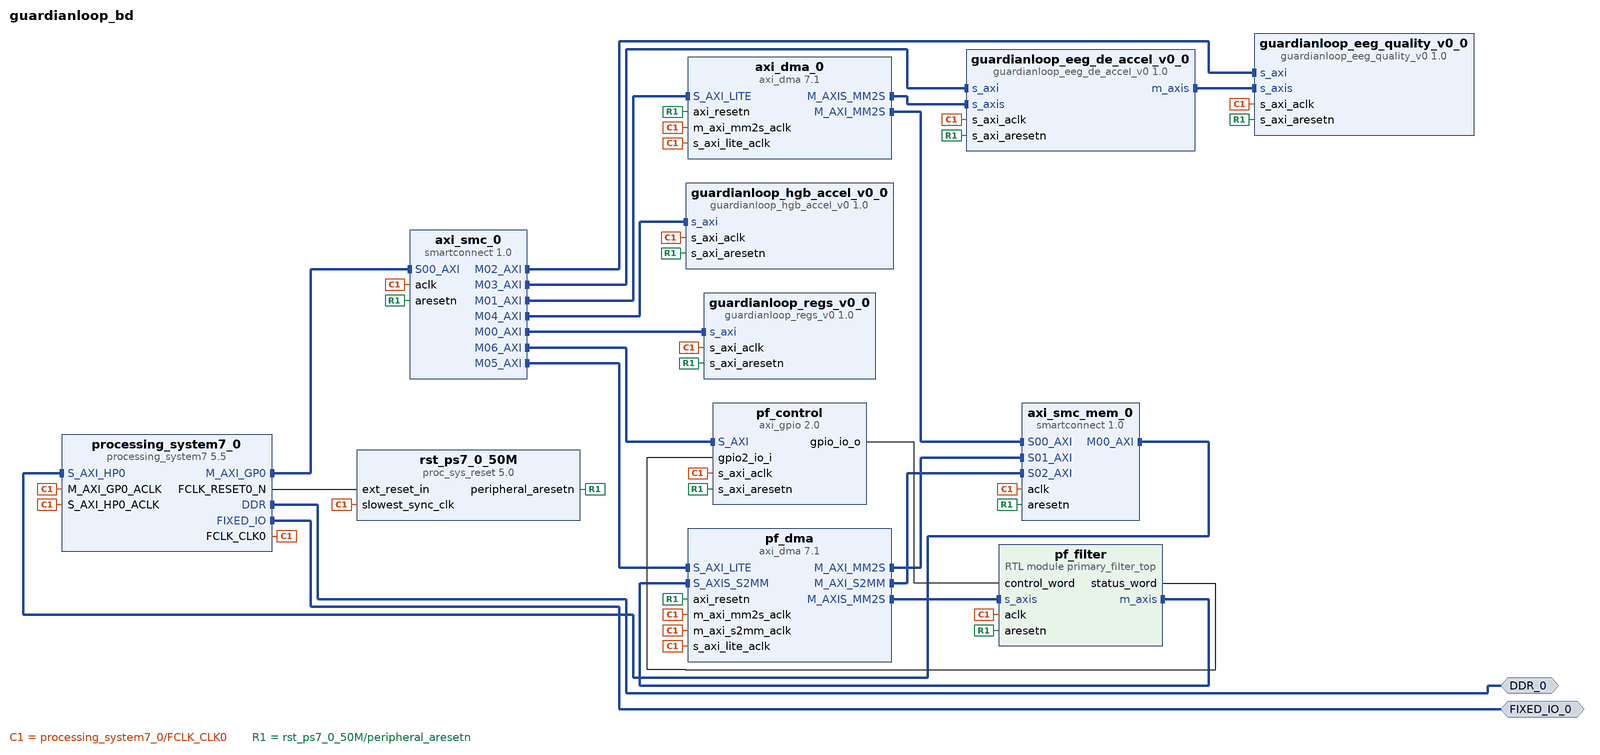
[diagram p0: block diagram of the top level]
# Vivado block design guardianloop_bd, xc7z015clg485-2, Vivado 2025.2
create_bd_design guardianloop_bd

create_bd_intf_port -mode Master -vlnv xilinx.com:interface:ddrx_rtl:1.0 DDR_0
create_bd_intf_port -mode Master -vlnv xilinx.com:display_processing_system7:fixedio_rtl:1.0 FIXED_IO_0

create_bd_cell -type ip -vlnv xilinx.com:ip:processing_system7:5.5 processing_system7_0
set_property -dict [list \
  CONFIG.PCW_FPGA0_PERIPHERAL_FREQMHZ 50 \
  CONFIG.PCW_QSPI_GRP_SINGLE_SS_ENABLE 1 \
  CONFIG.PCW_QSPI_GRP_SINGLE_SS_IO {MIO 1 .. 6} \
  CONFIG.PCW_QSPI_PERIPHERAL_ENABLE 1 \
  CONFIG.PCW_QSPI_QSPI_IO {MIO 1 .. 6} \
  CONFIG.PCW_SINGLE_QSPI_DATA_MODE x4 \
  CONFIG.PCW_UART0_PERIPHERAL_ENABLE 1 \
  CONFIG.PCW_UART0_UART0_IO {MIO 14 .. 15} \
  CONFIG.PCW_UART_PERIPHERAL_FREQMHZ 100 \
  CONFIG.PCW_UIPARAM_DDR_FREQ_MHZ 533.333333 \
  CONFIG.PCW_UIPARAM_DDR_MEMORY_TYPE {DDR 3 (Low Voltage)} \
  CONFIG.PCW_UIPARAM_DDR_PARTNO Custom \
  CONFIG.PCW_USE_S_AXI_HP0 1 \
] [get_bd_cells processing_system7_0]
# 142 more settings of processing_system7_0 are not shown: defaults, MIO pin electricals, DDR timing, and values the tool derives
create_bd_cell -type ip -vlnv xilinx.com:ip:proc_sys_reset:5.0 rst_ps7_0_50M
create_bd_cell -type ip -vlnv xilinx.com:ip:smartconnect:1.0 axi_smc_0
set_property -dict {CONFIG.NUM_MI 7 CONFIG.NUM_SI 1} [get_bd_cells axi_smc_0]
create_bd_cell -type ip -vlnv guardianloop.org:user:guardianloop_regs_v0:1.0 guardianloop_regs_v0_0
create_bd_cell -type ip -vlnv xilinx.com:ip:axi_dma:7.1 axi_dma_0
set_property -dict [list \
  CONFIG.c_include_s2mm 0 \
  CONFIG.c_include_sg 0 \
  CONFIG.c_m_axi_mm2s_data_width 128 \
  CONFIG.c_m_axis_mm2s_tdata_width 128 \
  CONFIG.c_mm2s_burst_size 4 \
  CONFIG.c_sg_length_width 16 \
] [get_bd_cells axi_dma_0]
create_bd_cell -type ip -vlnv guardianloop.org:user:guardianloop_eeg_quality_v0:1.0 guardianloop_eeg_quality_v0_0
create_bd_cell -type ip -vlnv xilinx.com:ip:smartconnect:1.0 axi_smc_mem_0
set_property -dict {CONFIG.NUM_MI 1 CONFIG.NUM_SI 3} [get_bd_cells axi_smc_mem_0]
create_bd_cell -type ip -vlnv guardianloop.org:user:guardianloop_eeg_de_accel_v0:1.0 guardianloop_eeg_de_accel_v0_0
create_bd_cell -type ip -vlnv guardianloop.org:user:guardianloop_hgb_accel_v0:1.0 guardianloop_hgb_accel_v0_0
create_bd_cell -type module -reference primary_filter_top pf_filter
create_bd_cell -type ip -vlnv xilinx.com:ip:axi_dma:7.1 pf_dma
set_property -dict [list \
  CONFIG.c_addr_width 32 \
  CONFIG.c_include_mm2s 1 \
  CONFIG.c_include_s2mm 1 \
  CONFIG.c_include_sg 0 \
  CONFIG.c_m_axi_mm2s_data_width 64 \
  CONFIG.c_m_axi_s2mm_data_width 64 \
  CONFIG.c_m_axis_mm2s_tdata_width 64 \
  CONFIG.c_s_axis_s2mm_tdata_width 64 \
  CONFIG.c_sg_length_width 16 \
] [get_bd_cells pf_dma]
create_bd_cell -type ip -vlnv xilinx.com:ip:axi_gpio:2.0 pf_control
set_property -dict [list \
  CONFIG.C_ALL_INPUTS_2 1 \
  CONFIG.C_ALL_OUTPUTS 1 \
  CONFIG.C_DOUT_DEFAULT 0x00000001 \
  CONFIG.C_GPIO2_WIDTH 32 \
  CONFIG.C_GPIO_WIDTH 32 \
  CONFIG.C_IS_DUAL 1 \
] [get_bd_cells pf_control]

# ---- connections ----

connect_bd_intf_net [get_bd_intf_pins axi_dma_0/M_AXIS_MM2S] [get_bd_intf_pins guardianloop_eeg_de_accel_v0_0/s_axis]
connect_bd_intf_net [get_bd_intf_pins axi_dma_0/M_AXI_MM2S] [get_bd_intf_pins axi_smc_mem_0/S00_AXI]
connect_bd_intf_net [get_bd_intf_pins axi_smc_0/M00_AXI] [get_bd_intf_pins guardianloop_regs_v0_0/s_axi]
connect_bd_intf_net [get_bd_intf_pins axi_smc_0/M01_AXI] [get_bd_intf_pins axi_dma_0/S_AXI_LITE]
connect_bd_intf_net [get_bd_intf_pins axi_smc_0/M02_AXI] [get_bd_intf_pins guardianloop_eeg_quality_v0_0/s_axi]
connect_bd_intf_net [get_bd_intf_pins axi_smc_0/M03_AXI] [get_bd_intf_pins guardianloop_eeg_de_accel_v0_0/s_axi]
connect_bd_intf_net [get_bd_intf_pins axi_smc_0/M04_AXI] [get_bd_intf_pins guardianloop_hgb_accel_v0_0/s_axi]
connect_bd_intf_net [get_bd_intf_pins axi_smc_0/M05_AXI] [get_bd_intf_pins pf_dma/S_AXI_LITE]
connect_bd_intf_net [get_bd_intf_pins axi_smc_0/M06_AXI] [get_bd_intf_pins pf_control/S_AXI]
connect_bd_intf_net [get_bd_intf_pins axi_smc_mem_0/M00_AXI] [get_bd_intf_pins processing_system7_0/S_AXI_HP0]
connect_bd_intf_net [get_bd_intf_pins guardianloop_eeg_de_accel_v0_0/m_axis] [get_bd_intf_pins guardianloop_eeg_quality_v0_0/s_axis]
connect_bd_intf_net [get_bd_intf_pins pf_dma/M_AXIS_MM2S] [get_bd_intf_pins pf_filter/s_axis]
connect_bd_intf_net [get_bd_intf_pins pf_dma/M_AXI_MM2S] [get_bd_intf_pins axi_smc_mem_0/S01_AXI]
connect_bd_intf_net [get_bd_intf_pins pf_dma/M_AXI_S2MM] [get_bd_intf_pins axi_smc_mem_0/S02_AXI]
connect_bd_intf_net [get_bd_intf_pins pf_filter/m_axis] [get_bd_intf_pins pf_dma/S_AXIS_S2MM]
connect_bd_intf_net [get_bd_intf_ports DDR_0] [get_bd_intf_pins processing_system7_0/DDR]
connect_bd_intf_net [get_bd_intf_ports FIXED_IO_0] [get_bd_intf_pins processing_system7_0/FIXED_IO]
connect_bd_intf_net [get_bd_intf_pins processing_system7_0/M_AXI_GP0] [get_bd_intf_pins axi_smc_0/S00_AXI]
connect_bd_net [get_bd_pins pf_control/gpio_io_o] [get_bd_pins pf_filter/control_word]
connect_bd_net [get_bd_pins pf_filter/status_word] [get_bd_pins pf_control/gpio2_io_i]
connect_bd_net [get_bd_pins processing_system7_0/FCLK_CLK0] \
  [get_bd_pins rst_ps7_0_50M/slowest_sync_clk] [get_bd_pins guardianloop_regs_v0_0/s_axi_aclk] \
  [get_bd_pins guardianloop_eeg_quality_v0_0/s_axi_aclk] [get_bd_pins axi_dma_0/s_axi_lite_aclk] \
  [get_bd_pins axi_dma_0/m_axi_mm2s_aclk] [get_bd_pins axi_smc_0/aclk] [get_bd_pins axi_smc_mem_0/aclk] \
  [get_bd_pins processing_system7_0/M_AXI_GP0_ACLK] [get_bd_pins processing_system7_0/S_AXI_HP0_ACLK] \
  [get_bd_pins guardianloop_eeg_de_accel_v0_0/s_axi_aclk] [get_bd_pins guardianloop_hgb_accel_v0_0/s_axi_aclk] \
  [get_bd_pins pf_filter/aclk] [get_bd_pins pf_dma/s_axi_lite_aclk] [get_bd_pins pf_dma/m_axi_mm2s_aclk] \
  [get_bd_pins pf_dma/m_axi_s2mm_aclk] [get_bd_pins pf_control/s_axi_aclk]
connect_bd_net [get_bd_pins processing_system7_0/FCLK_RESET0_N] [get_bd_pins rst_ps7_0_50M/ext_reset_in]
connect_bd_net [get_bd_pins rst_ps7_0_50M/peripheral_aresetn] \
  [get_bd_pins guardianloop_regs_v0_0/s_axi_aresetn] [get_bd_pins guardianloop_eeg_quality_v0_0/s_axi_aresetn] \
  [get_bd_pins axi_dma_0/axi_resetn] [get_bd_pins axi_smc_0/aresetn] [get_bd_pins axi_smc_mem_0/aresetn] \
  [get_bd_pins guardianloop_eeg_de_accel_v0_0/s_axi_aresetn] [get_bd_pins guardianloop_hgb_accel_v0_0/s_axi_aresetn] \
  [get_bd_pins pf_filter/aresetn] [get_bd_pins pf_dma/axi_resetn] [get_bd_pins pf_control/s_axi_aresetn]

# ---- address map ----
assign_bd_address -offset 0x00000000 -range 1G -target_address_space [get_bd_addr_spaces axi_dma_0/Data_MM2S] [get_bd_addr_segs processing_system7_0/S_AXI_HP0/HP0_DDR_LOWOCM]
assign_bd_address -offset 0x00000000 -range 1G -target_address_space [get_bd_addr_spaces pf_dma/Data_MM2S] [get_bd_addr_segs processing_system7_0/S_AXI_HP0/HP0_DDR_LOWOCM]
assign_bd_address -offset 0x00000000 -range 1G -target_address_space [get_bd_addr_spaces pf_dma/Data_S2MM] [get_bd_addr_segs processing_system7_0/S_AXI_HP0/HP0_DDR_LOWOCM]
assign_bd_address -offset 0x40000000 -range 4K -target_address_space [get_bd_addr_spaces processing_system7_0/Data] [get_bd_addr_segs guardianloop_regs_v0_0/s_axi/reg0]
assign_bd_address -offset 0x40001000 -range 4K -target_address_space [get_bd_addr_spaces processing_system7_0/Data] [get_bd_addr_segs guardianloop_eeg_quality_v0_0/s_axi/reg0]
assign_bd_address -offset 0x40002000 -range 4K -target_address_space [get_bd_addr_spaces processing_system7_0/Data] [get_bd_addr_segs guardianloop_eeg_de_accel_v0_0/s_axi/reg0]
assign_bd_address -offset 0x40003000 -range 4K -target_address_space [get_bd_addr_spaces processing_system7_0/Data] [get_bd_addr_segs guardianloop_hgb_accel_v0_0/s_axi/reg0]
assign_bd_address -offset 0x40400000 -range 64K -target_address_space [get_bd_addr_spaces processing_system7_0/Data] [get_bd_addr_segs axi_dma_0/S_AXI_LITE/Reg]
assign_bd_address -offset 0x40410000 -range 64K -target_address_space [get_bd_addr_spaces processing_system7_0/Data] [get_bd_addr_segs pf_dma/S_AXI_LITE/Reg]
assign_bd_address -offset 0x41200000 -range 64K -target_address_space [get_bd_addr_spaces processing_system7_0/Data] [get_bd_addr_segs pf_control/S_AXI/Reg]

validate_bd_design
save_bd_design
